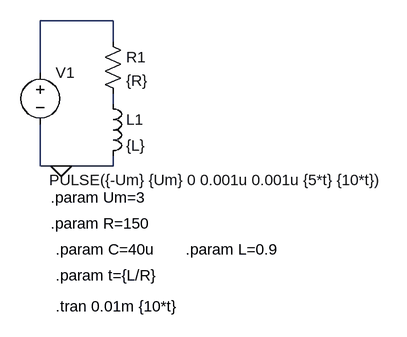
[diagram p0: schematic LAB2.2.asc]
LAB2.2.asc, the LTspice schematic file:
Version 4.1
SHEET 1 880 680
WIRE 240 0 128 0
WIRE 240 32 240 0
WIRE 128 80 128 0
WIRE 240 128 240 112
WIRE 128 224 128 160
WIRE 160 224 128 224
WIRE 240 224 240 208
WIRE 240 224 160 224
FLAG 160 224 0
SYMBOL res 224 16 R0
SYMATTR InstName R1
SYMATTR Value {R}
SYMBOL voltage 128 64 R0
WINDOW 3 14 181 Left 2
WINDOW 123 0 0 Left 0
WINDOW 39 0 0 Left 0
SYMATTR InstName V1
SYMATTR Value PULSE({-Um} {Um} 0 0.001u 0.001u {5*t} {10*t})
SYMBOL ind 224 112 R0
SYMATTR InstName L1
SYMATTR Value {L}
SYMATTR SpiceLine Rser=1m
TEXT 144 272 Left 2 !.param Um=3
TEXT 144 312 Left 2 !.param R=150
TEXT 152 352 Left 2 !.param C=40u
TEXT 152 392 Left 2 !.param t={L/R}
TEXT 152 440 Left 2 !.tran 0.01m {10*t}
TEXT 352 352 Left 2 !.param L=0.9

The netlist it stands for:
* LAB2.2.asc
R1 N001 N002 {R}
V1 N001 0 PULSE({-Um} {Um} 0 0.001u 0.001u {5*t} {10*t})
L1 N002 0 {L} Rser=1m
.param Um=3
.param R=150
.param C=40u
.param t={L/R}
.tran 0.01m {10*t}
.param L=0.9
.backanno
.end